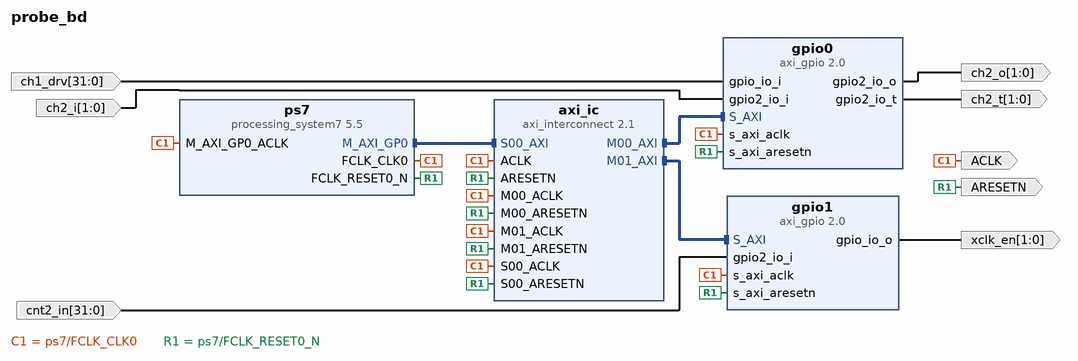
[diagram p0: block diagram of the top level]
# Vivado block design probe_bd, xc7z020clg400-2, Vivado 2019.1
create_bd_design probe_bd

create_bd_port -dir O ACLK
create_bd_port -dir O -type rst ARESETN
create_bd_port -dir I -from 31 -to 0 ch1_drv
create_bd_port -dir I -from 1 -to 0 ch2_i
create_bd_port -dir O -from 1 -to 0 ch2_o
create_bd_port -dir O -from 1 -to 0 ch2_t
create_bd_port -dir O -from 1 -to 0 xclk_en
create_bd_port -dir I -from 31 -to 0 cnt2_in

create_bd_cell -type ip -vlnv xilinx.com:ip:processing_system7:5.5 ps7
set_property -dict {CONFIG.PCW_FPGA0_PERIPHERAL_FREQMHZ 100} [get_bd_cells ps7]
# 32 more settings of ps7 are not shown: defaults, MIO pin electricals, DDR timing, and values the tool derives
create_bd_cell -type ip -vlnv xilinx.com:ip:axi_gpio:2.0 gpio0
set_property -dict {CONFIG.C_ALL_INPUTS 1 CONFIG.C_GPIO2_WIDTH 2 CONFIG.C_GPIO_WIDTH 32 CONFIG.C_IS_DUAL 1} [get_bd_cells gpio0]
create_bd_cell -type ip -vlnv xilinx.com:ip:axi_gpio:2.0 gpio1
set_property -dict {CONFIG.C_ALL_INPUTS_2 1 CONFIG.C_GPIO2_WIDTH 32 CONFIG.C_GPIO_WIDTH 2 CONFIG.C_IS_DUAL 1} [get_bd_cells gpio1]
create_bd_cell -type ip -vlnv xilinx.com:ip:axi_interconnect:2.1 axi_ic
set_property -dict {CONFIG.NUM_MI 2 CONFIG.NUM_SI 1} [get_bd_cells axi_ic]

# ---- connections ----

connect_bd_intf_net [get_bd_intf_pins axi_ic/M01_AXI] [get_bd_intf_pins gpio1/S_AXI]
connect_bd_intf_net [get_bd_intf_pins ps7/M_AXI_GP0] [get_bd_intf_pins axi_ic/S00_AXI]
connect_bd_intf_net [get_bd_intf_pins axi_ic/M00_AXI] [get_bd_intf_pins gpio0/S_AXI]
connect_bd_net [get_bd_pins ps7/FCLK_CLK0] \
  [get_bd_ports ACLK] [get_bd_pins ps7/M_AXI_GP0_ACLK] [get_bd_pins axi_ic/ACLK] [get_bd_pins axi_ic/S00_ACLK] \
  [get_bd_pins axi_ic/M00_ACLK] [get_bd_pins axi_ic/M01_ACLK] [get_bd_pins gpio0/s_axi_aclk] [get_bd_pins gpio1/s_axi_aclk]
connect_bd_net [get_bd_pins ps7/FCLK_RESET0_N] \
  [get_bd_ports ARESETN] [get_bd_pins axi_ic/ARESETN] [get_bd_pins axi_ic/S00_ARESETN] [get_bd_pins axi_ic/M00_ARESETN] \
  [get_bd_pins axi_ic/M01_ARESETN] [get_bd_pins gpio0/s_axi_aresetn] [get_bd_pins gpio1/s_axi_aresetn]
connect_bd_net [get_bd_ports ch1_drv] [get_bd_pins gpio0/gpio_io_i]
connect_bd_net [get_bd_ports ch2_i] [get_bd_pins gpio0/gpio2_io_i]
connect_bd_net [get_bd_pins gpio0/gpio2_io_o] [get_bd_ports ch2_o]
connect_bd_net [get_bd_pins gpio0/gpio2_io_t] [get_bd_ports ch2_t]
connect_bd_net [get_bd_pins gpio1/gpio_io_o] [get_bd_ports xclk_en]
connect_bd_net [get_bd_ports cnt2_in] [get_bd_pins gpio1/gpio2_io_i]

# ---- address map ----
assign_bd_address -offset 0x41200000 -range 64K -target_address_space [get_bd_addr_spaces ps7/Data] [get_bd_addr_segs gpio0/S_AXI/Reg]
assign_bd_address -offset 0x41210000 -range 64K -target_address_space [get_bd_addr_spaces ps7/Data] [get_bd_addr_segs gpio1/S_AXI/Reg]

validate_bd_design
save_bd_design
